# Altium project abdullah-liquidlevelrelay.PrjPcb
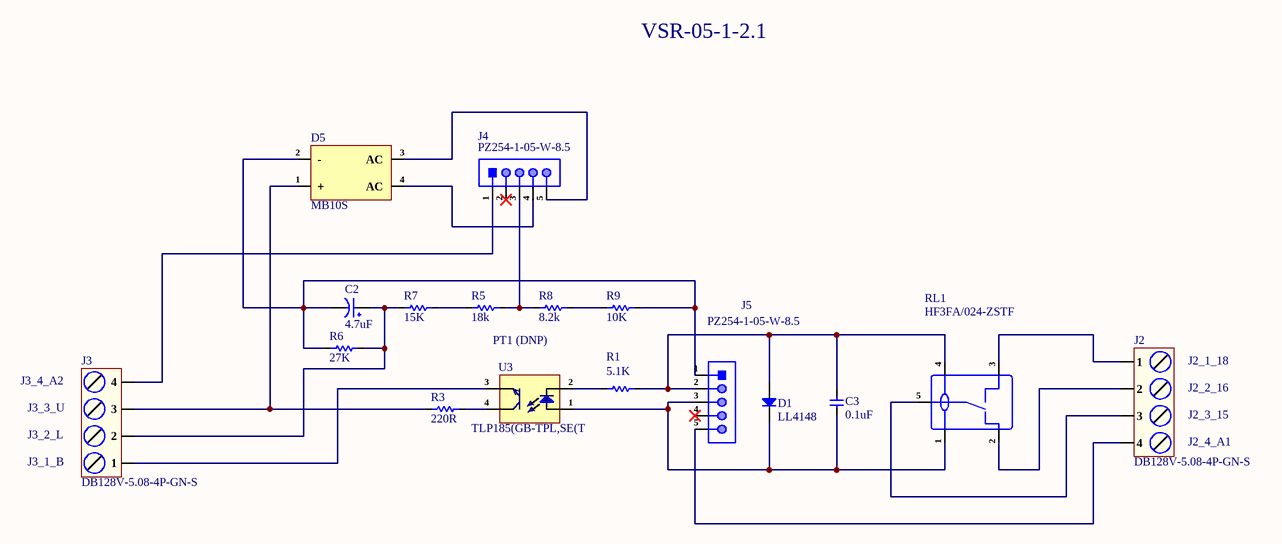
[diagram p0: VSR-05-1-2.1.SchDoc]
2 sheets, 34 parts. Net scope: global (net labels, ports and power ports of the same name join across sheets).
Sheets:
  VSR-05-1-2.1.SchDoc
  VSR-05-2-2.1.SchDoc

## Sheet VSR-05-1-2.1.SchDoc
size A4; SheetNumber: 1; SheetTotal: 1

### Parts
C2  4.7uF  [VT1H4R7M0405]
C3  0.1uF  [Cap-1206]
D1  LL4148  [LL-34]
D5  MB10S  [MBS10S]
J2  DB128V-5.08-4P-GN-S  [DB128V-5.08-4P-GN-S]
J3  DB128V-5.08-4P-GN-S  [DB128V-5.08-4P-GN-S]
J4  PZ254-1-05-W-8.5  [HDR1X5 (R\A)]
J5  PZ254-1-05-W-8.5  [HDR1X5 (R\A)]
R1  5.1K  [RES-0805]
R3  220R  [Res-1206]
R5  18k  [RES-0805]
R6  27K  [RES-0805]
R7  15K  [RES-0805]
R8  8.2k  [RES-0805]
R9  10K  [RES-0805]
RL1  HF3FA/024-ZSTF  [HF3FA/024-ZSTF]
U3  TLP185(GB-TPL,SE(T  [SOP-4_2.54]

### Nets
NetC2_1: C2.1 J3.2 R6.2 R7.1
NetC2_2: C2.2 D5.2(-) J5.1 R6.1 R9.2
NetC3_1: C3.1 D1.2(K) J5.3 RL1.1 U3.1(An)
NetC3_2: C3.2 D1.1(A) J5.2 R1.2 RL1.4
NetD5_1: D5.1(+) J3.3 R3.1
NetD5_3: D5.3(AC) J4.5
NetD5_4: D5.4(AC) J4.4
NetJ2_1: J2.1 RL1.3
NetJ2_2: J2.2 RL1.2
NetJ2_3: J2.3 RL1.5
NetJ2_4: J2.4 J5.5
NetJ3_1: J3.1 U3.3(E)
NetJ3_4: J3.4 J4.1
NetJ4_3: J4.3 R5.2 R8.1
NetR1_1: R1.1 U3.2(Ca)
NetR3_2: R3.2 U3.4(C)
NetR5_1: R5.1 R7.2
NetR8_2: R8.2 R9.1

Not connected (* = marked no-connect by the designer): J4 2*; J5 4*

### Notes on the sheet
- VSR-05-1-2.1
- PT1 (DNP)
- J2_1_18
- J3_4_A2
- J3_3_U
- J3_2_L
- J2_2_16
- J2_3_15
- J3_1_B
- J2_4_A1
- File:
- Title:
- Date:
- Page
- Num:
- Total:
- Drawn By: Huzaifa Ali

### Library data of the parts
C2 = VT1H4R7M0405: 4.7uF 50V 14mA@120Hz ±20% SMD,D4xL5.4mm Aluminum Electrolytic Capacitors - SMD ROHS; Manufacturer: Roqang; Supplier: LCSC; LCSC Part Number: C213488; Manufacturer Part Number: VT1H4R7M0405; RoHS: No; Item Type: Capacitor
C3 = CC1206KKX7R0BB104: CAP CER 0.1UF 100V X7R 1206; Manufacturer: Yageo; Dielectric Material: Ceramic; Tolerance: 10%; Voltage: 63V; Capacitance: 100nF; Item Type: Capacitor; Supplier 1: Avnet; Manufacturer Part Number: CC1206KKX7R0BB104; RoHS: Yes; Category: Ceramic Capacitors; Stock 1: 24000; Pricing 1: 3000=0.01588, 6000=0.01565, 12000=0.01520, 18000=0.01486, 24000=0.01429, 30000=0.01395, 300000=0.01361 (USD); Mount: Surface Mount; Case/Package: 1206; Number of Pins: 2; Case Code (Metric): 3216; Case Code (Imperial): 1206; Min Operating Temperature: -55°C; Max Operating Temperature: 125°C; Dielectric: X7R; Package Quantity: 1; Voltage Rating: 100V; Packaging: Tape and Reel; Voltage Rating (DC): 100V; Termination: SMD/SMT; Resistor Type: Ceramic; Series: CC; Length: 3.2mm; Width: 0.063inch; Height: 1.25mm; Thickness: 0.057inch; Depth: 1.6mm; Radiation Hardening: No; RoHS Compliant: Yes; Reach SVHC Compliant: Yes; Lead Free: Lead Free; ComponentLink1URL: https://datasheet.ciiva.com/7978/1447671-7978227.pdf?src-supplier=Element14; ComponentLink1Description: https://datasheet.ciiva.com/7978/1447671-7978227.pdf?src-supplier=Element14; ComponentLink2URL: https://datasheet.ciiva.com/46391/1919308-46391993.pdf?src-supplier=Element14; ComponentLink2Description: https://datasheet.ciiva.com/46391/1919308-46391993.pdf?src-supplier=Element14; ComponentLink3URL: https://datasheet.ciiva.com/180/mlccorderingcode-180145.pdf?src-supplier=Digi-Key; ComponentLink3Description: https://datasheet.ciiva.com/180/mlccorderingcode-180145.pdf?src-supplier=Digi-Key; ComponentLink4URL: https://datasheet.ciiva.com/180/mlccorderingcode-180144.pdf?src-supplier=Digi-Key; ComponentLink4Description: https://datasheet.ciiva.com/180/mlccorderingcode-180144.pdf?src-supplier=Digi-Key; ComponentLink5URL: https://datasheet.ciiva.com/180/mlccorderingcode-180146.pdf?src-supplier=Digi-Key; ComponentLink5Description: https://datasheet.ciiva.com/180/mlccorderingcode-180146.pdf?src-supplier=Digi-Key; ComponentLink6URL: https://datasheet.ciiva.com/5425/upy-gp-np0-16v-to-50v-8-5425573.pdf?src-supplier=Mouser; ComponentLink6Description: https://datasheet.ciiva.com/5425/upy-gp-np0-16v-to-50v-8-5425573.pdf?src-supplier=Mouser; ComponentLink7URL: https://datasheet.ciiva.com/16981/upy-np0x7r-mv-100-to-630v-9-16981180.pdf?src-supplier=Future+Electronics; ComponentLink7Description: https://datasheet.ciiva.com/16981/upy-np0x7r-mv-100-to-630v-9-16981180.pdf?src-supplier=Future+Electronics; ComponentLink8URL: https://datasheet.ciiva.com/26829/getdatasheetpartid-403790-26829655.pdf?src-supplier=Verical; ComponentLink8Description: https://datasheet.ciiva.com/26829/getdatasheetpartid-403790-26829655.pdf?src-supplier=Verical; Supplier Part Number 1: CC1206KKX7R0BB104; LCSC Part Number: C107181
D1 = LL4148: 75V 1V@10mA 4ns 200mA LL-34 Switching Diode ROHS; Manufacturer: MDD; Manufacturer Part Number: LL4148; Package: LL-34; LCSC Part Number: C435829; Item Type: Diode; ComponentLink1Description: LCSC; ComponentLink1URL: https://www.lcsc.com/product-detail/Switching-Diode_MDD-Microdiode-Electronics-LL4148_C435829.html
D5 = MB10S: 35A 1.1V@400mA 1A 1kV MBS Bridge Rectifiers ROHS; Manufacturer: MDD; Manufacturer Part Number: MB10S; Package: MBS; JLCPCB Part Number: C2488; Item Type: Bridge Rectifier; ComponentLink1Description: LCSC; ComponentLink1URL: https://www.lcsc.com/product-detail/Bridge-Rectifiers_MCC_MB6S-TP_MB6S-TP_C85619.html?gclid=CjwKCAjwjOunBhB4EiwA94JWsPhP5VxdRhkKtNAXxaeRo8Kbw1z5VNRY74bvbkYd4a4LtLXYHGrsEhoCPX4QAvD_BwE
J2 J3 = DB128V-5.08-4P-GN-S: 1x4P 20A -40℃~+105℃ 300V Green 12~30 Straight 5.08mm 2.5 1 4 Plugin,P=5.08mm Screw terminal ROHS; Manufacturer: DORABO; Manufacturer Part Number: DB128V-5.08-4P-GN-S; Package: Plugin,P=5.08mm; LCSC Part Number: C2915641; Item Type: Screw terminal; ComponentLink1Description: LCSC; ComponentLink1URL: https://www.lcsc.com/product-detail/Screw-terminal_DORABO-DB128V-5-08-4P-GN-S_C2915641.html
J4 J5 = PZ254-1-05-W-8.5: 3A Right-Angle Square Pins 2.5mm 260℃@10S 5P 6mm -40℃~+105℃ 2.54mm Plugin Black 1x5P Push-Pull,P=2.54mm Pin Headers ROHS; Manufacturer: HCTL; Manufacturer Part Number: PZ254-1-05-W-8.5; Package: Push-Pull,P=2.54mm; LCSC Part Number: C2894947; Item Type: Pin Headers; ComponentLink1Description: LCSC; ComponentLink1URL: https://www.lcsc.com/product-detail/Pin-Headers_HCTL-PZ254-1-05-W-8-5_C2894947.html
R1 = 0805W8F5101T5E: 125mW Thick Film Resistors 150V ±100ppm/℃ ±1% 5.1kΩ 0805 Chip Resistor - Surface Mount ROHS; Manufacturer: UNI-ROYAL; Manufacturer Part Number: 0805W8F5101T5E; Package: 0805; LCSC Part Number: C27834; Item Type: Resistor; ComponentLink1Description: LCSC; ComponentLink1URL: https://www.lcsc.com/product-detail/Chip-Resistor-Surface-Mount_UNI-ROYAL-Uniroyal-Elec-0805W8F5101T5E_C27834.html
R3 = 1206W4F2200T5E: 250mW Thick Film Resistors 200V ±100ppm/℃ ±1% 220Ω 1206 Chip Resistor - Surface Mount ROHS; Manufacturer: Uniroyal; Supplier: LCSC; LCSC Part Number: C17957; Manufacturer Part Number: 1206W4F2200T5E; RoHS: No; Category: LDO; Item Type: Resistor
R5 = 0805W8F1802T5E: 125mW Thick Film Resistors 150V ±100ppm/℃ ±1% 18kΩ 0805 Chip Resistor - Surface Mount ROHS; Manufacturer: Royal Electronic Factory; Value: 18kR; Supplier: Mouser; Supplier Part Number: 303-0805W8F1802T5E; Manufacturer Part Number: 0805W8F1802T5E; RoHS: No; Stock: 80000; Pricing: 10000=0.002 (USD); LCSC Part Number: C17506; Item Type: Resistor
R6 = 0805W8F2702T5E: 125mW Thick Film Resistors 150V ±100ppm/℃ ±1% 27kΩ 0805 Chip Resistor - Surface Mount ROHS; Manufacturer: Royal Electronic Factory; Value: 27kR; Supplier: Mouser; Supplier Part Number: 303-0805W8F2702T5E; Manufacturer Part Number: 0805W8F2702T5E; RoHS: No; Item Type: Resistor; Stock: 75000; Pricing: 10000=0.002 (USD); LCSC Part Number: C17593
R7 = 0805W8F1502T5E: 125mW Thick Film Resistors 150V ±100ppm/℃ ±1% 15kΩ 0805 Chip Resistor - Surface Mount ROHS; Manufacturer: Uniroyal; Supplier: LCSC; LCSC Part Number: C17475; Manufacturer Part Number: 0805W8F1502T5E; RoHS: Yes; Category: LDO; Item Type: Resistor
R8 = 0805W8F8201T5E: 125mW Thick Film Resistors 150V ±100ppm/℃ ±1% 8.2kΩ 0805 Chip Resistor - Surface Mount ROHS; Manufacturer: Royal Electronic Factory; Value: 8.2kR; Supplier: Mouser; Supplier Part Number: 303-0805W8F8201T5E; Manufacturer Part Number: 0805W8F8201T5E; RoHS: No; Item Type: Resistor; Pricing: 10000=0.002 (USD); LCSC Part Number: C17828
R9 = RC0805FR-7W10KL: RES 10K OHM 1% 1/4W 0805; Manufacturer: Yageo; Item Type: Resistor; Supplier: Avnet; Supplier Part Number: 49AK3472; Manufacturer Part Number: RC0805FR-7W10KL; RoHS: Yes; Category: Chip SMD Resistors; Stock: 5000; Pricing: 1=0.153, 25=0.038, 50=0.03, 100=0.02 (USD); LCSC Part Number: C723404
RL1 = HF3FA/024-ZSTF: 24V SPDT (1 Form C) Plugin,15.2x19mm Power Relays ROHS; Manufacturer: HF(Xiamen Hongfa Electroacoustic); Manufacturer Part Number: HF3FA/024-ZSTF; Package: Plugin,15.2x19mm; LCSC Part Number: C194242; Item Type: Power Relay; ComponentLink1Description: LCSC; ComponentLink1URL: https://www.lcsc.com/product-detail/Power-Relays_HF-Xiamen-Hongfa-Electroacoustic-HF3FA-024-ZSTF_C194242.html
U3 = TLP185(GB-TPL,SE(T: 80V 3.75kV 50mA 300mV@2.4mA,8mA 1 5V 1.25V DC SOP-4-2.54mm Transistor Output Optocoupler ROHS; Manufacturer: TOSHIBA; Manufacturer Part Number: TLP185(GB-TPL,SE(T; Package: SOP-4-2.54mm; LCSC Part Number: C7240; Item Type: Optocoupler; ComponentLink1Description: LCSC; ComponentLink1URL: https://www.lcsc.com/product-detail/Transistor-Output-Optocoupler_TOSHIBA-TLP185-GB-TPL-SE-T_C7240.html

## Sheet VSR-05-2-2.1.SchDoc
size A4; SheetNumber: 2; SheetTotal: 2
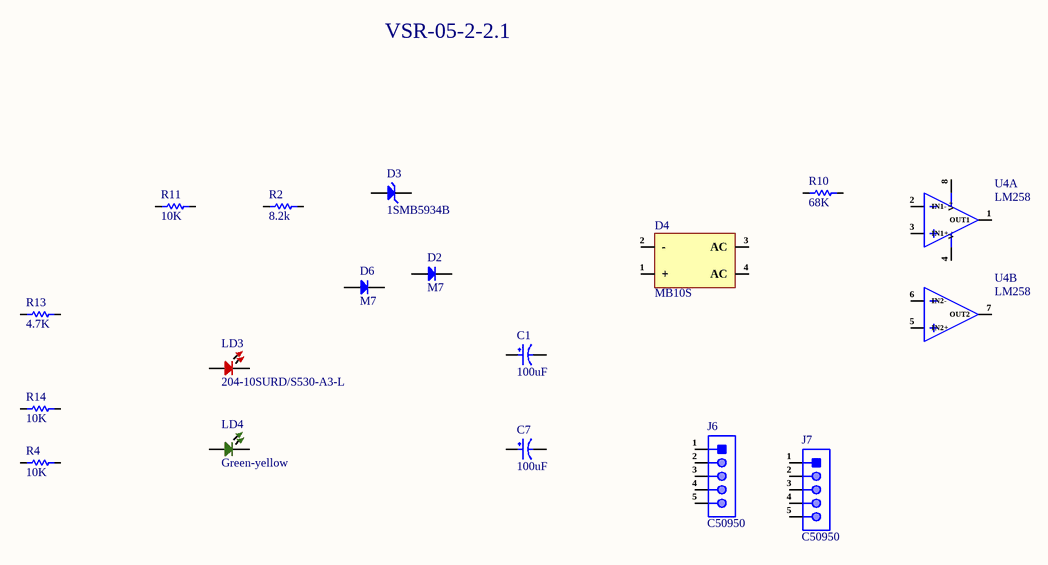
[diagram p1: VSR-05-2-2.1.SchDoc]

### Parts
C1  100uF  [RVT1H101M0607]
C7  100uF  [RVT1H101M0607]
D2  M7  [SMA(DO-214AC)]
D3  1SMB5934B  [SMB_]
D4  MB10S  [MBS10S]
D6  M7  [SMA(DO-214AC)]
J6  C50950  [HDR 1x5 Female]
J7  C50950  [HDR 1x5 Female]
LD3  204-10SURD/S530-A3-L
LD4  Green-yellow  [TH LED Green 3MM]
R2  8.2k  [RES-0805]
R4  10K  [RES-0805]
R10  68K  [RES-0805]
R11  10K  [RES-0805]
R13  4.7K  [RES-0805]
R14  10K  [RES-0805]
U4  LM258  [SOP-8]  (parts A,B of 2)

### Nets

Not connected (* = marked no-connect by the designer): C1 1 2; C7 1 2; D2 1(K) 2(A); D3 1(A) 2(K); D4 1(+) 2(-) 3(AC) 4(AC); D6 1(K) 2(A); J6 1 2 3 4 5; J7 1 2 3 4 5; LD3 1 2; LD4 1 2; R2 1 2; R4 1 2; R10 1 2; R11 1 2; R13 1 2; R14 1 2; U4 1(OUT1) 2(IN1-) 3(IN1+) 4(V-) 5(IN2+) 6(IN2-) 7(OUT2) 8(V+)

### Notes on the sheet
- VSR-05-2-2.1

### Library data of the parts
C1 C7 = RVT1H101M0607: 100uF 50V ±20% SMD,D6.3xL7.7mm Aluminum Electrolytic Capacitors - SMD ROHS; Manufacturer: ROQANG; Manufacturer Part Number: RVT1H101M0607; Package: SMD,D6.3xL7.7mm; LCSC Part Number: C3151829; Item Type: Capacitor; ComponentLink1Description: LCSC; ComponentLink1URL: https://www.lcsc.com/product-detail/Aluminum-Electrolytic-Capacitors-SMD_ROQANG-RVT1H101M0607_C3151829.html
D2 D6 = M7: 1A 1.1V@1A 1kV DO-214AC Diodes - General Purpose ROHS; Manufacturer: MSKSEMI; Item Type: Diode; Manufacturer Part Number: M7; Package: DO-214AC; LCSC Part Number: C2902910; ComponentLink1Description: LCSC; ComponentLink1URL: https://www.lcsc.com/product-detail/Diodes-General-Purpose_MSKSEMI-M7_C2902910.html
D3 = 1SMB5934B: 3W 24V SMB Zener Diodes ROHS; Manufacturer: YFW; Item Type: Diode; Manufacturer Part Number: 1SMB5934B; Package: SMB; LCSC Part Number: C2988044; ComponentLink1Description: LCSC; ComponentLink1URL: https://www.lcsc.com/product-detail/Zener-Diodes_YFW-1SMB5934B_C2988044.html
D4 = MB10S: as D5 on sheet VSR-05-1-2.1; Manufacturer Part Number: MB10S; Package: MBS; JLCPCB Part Number: C2488; Item Type: Bridge Rectifier; ComponentLink1Description: LCSC; ComponentLink1URL: https://www.lcsc.com/product-detail/Bridge-Rectifiers_MCC_MB6S-TP_MB6S-TP_C85619.html?gclid=CjwKCAjwjOunBhB4EiwA94JWsPhP5VxdRhkKtNAXxaeRo8Kbw1z5VNRY74bvbkYd4a4LtLXYHGrsEhoCPX4QAvD_BwE
J6 J7 = C50950: 2.54mm Plugin Straight 1x5P 5 Plugin,P=2.54mm Female Headers ROHS; Manufacturer: BOOMELE; Manufacturer Part Number: C50950; Package: Plugin,P=2.54mm; LCSC Part Number: C50950; Item Type: Female Header; ComponentLink1Description: LCSC; ComponentLink1URL: https://www.lcsc.com/product-detail/Female-Headers_BOOMELE-Boom-Precision-Elec-C50950_C50950.html
LD3 = 204-10SURD/S530-A3-L: 20mA 624nm -40℃~+85℃ Red 40° 3mm圆形灯头 60mW Plugin,D=3mm Light Emitting Diodes (LED) ROHS; Manufacturer: Everlight Elec; Manufacturer Part Number: 204-10SURD/S530-A3-L; Package: Plugin,D=3mm; LCSC Part Number: C99771; Item Type: LED; ComponentLink1Description: LCSC; ComponentLink1URL: https://www.lcsc.com/product-detail/Light-Emitting-Diodes-LED_Everlight-Elec-204-10SURD-S530-A3-L_C99771.html
LD4 = 204-10SYGD/S530-E3: LED Single Standard Yellow Green 573nm 25mA 2-Pin T-1 Bag; Manufacturer: Everlight; Viewing Angle: 45°; Luminous Intensity: 100mcd; Forward Voltage: 2.4V; Lens Style: Diffused,Colored; Power Dissipation: 60W; Number of Elements: 1; Reverse Voltage: 5V; Supplier: Digikey; Supplier Part Number: 1080-204-10SYGD/S530-E3TR-ND; Manufacturer Part Number: 204-10SYGD/S530-E3; RoHS: Yes; Pricing: 3000=0.10482, 5000=0.09847, 10000=0.09212, 25000=0.08449, 50000=0.08132, 100000=0.07941 (USD); Mounting Technology: Through Hole; Case/Package: T; Pins: 2; Min Operating Temperature: -40°C; Max Operating Temperature: 85°C; Forward Current: 25mA; Packaging: Tape and Reel; Dominant Wavelength: 573nm; Wavelength: 573nm; Length: 4mm; Depth: 4mm; Radiation Hardening: No; RoHS Compliant: Yes; ComponentLink1URL: https://datasheet.ciiva.com/26901/getdatasheetpartid-707371-26901329.pdf?src-supplier=Verical; ComponentLink1Description: https://datasheet.ciiva.com/26901/getdatasheetpartid-707371-26901329.pdf?src-supplier=Verical; LCSC Part Number: C85161; Item Type: LED
R2 = 0805W8F8201T5E: as R8 on sheet VSR-05-1-2.1; Supplier: Mouser; Supplier Part Number: 303-0805W8F8201T5E; Manufacturer Part Number: 0805W8F8201T5E; RoHS: No; Item Type: Resistor; Pricing: 10000=0.002 (USD); LCSC Part Number: C17828
R4 R11 R14 = RC0805FR-7W10KL: as R9 on sheet VSR-05-1-2.1; Supplier: Avnet; Supplier Part Number: 49AK3472; Manufacturer Part Number: RC0805FR-7W10KL; RoHS: Yes; Category: Chip SMD Resistors; Stock: 5000; Pricing: 1=0.153, 25=0.038, 50=0.03, 100=0.02 (USD); LCSC Part Number: C723404
R10 = 0805W8F6802T5E: 125mW Thick Film Resistors 150V ±100ppm/℃ ±1% 68kΩ 0805 Chip Resistor - Surface Mount ROHS; Manufacturer: Royal Electronic Factory; Value: 68kR; Supplier: Mouser; Supplier Part Number: 303-0805W8F6802T5E; Manufacturer Part Number: 0805W8F6802T5E; RoHS: Yes; Item Type: Resistor; Stock: 85000; Pricing: 10000=0.002 (USD); RoHS Compliant: Yes; LCSC Part Number: C17801
R13 = CRCW08054K70FKEAHP: RES SMD 4.7K OHM 1% 1/2W 0805; Manufacturer: Vishay; Power Rating: 330mW; Voltage Rating: 150V; Resistance: 4.7kR; Temperature Coefficient: 100ppm/°C; Max Power Dissipation: 500mW; Item Type: Resistor; Supplier 1: RSComponents; Manufacturer Part Number: CRCW08054K70FKEAHP; RoHS: Yes; Category: Chip SMD Resistors; Stock 1: 5000; Pricing 1: 25=0.16800, 100=0.15700, 250=0.14600, 500=0.13600, 1000=0.12500 (GBP); Mount: Surface Mount; Case/Package: 0805; Weight: 0.000194oz; Case Code (Imperial): 0805; Case Code (Metric): 2012; Contact Plating: Tin; Min Operating Temperature: -55°C; Max Operating Temperature: 155°C; Tolerance: 1%; Packaging: Tape and Reel; Package Quantity: 5000; Resistor Type: Thick Film; Termination: SMD/SMT; Voltage Rating (DC): 150V; Features: Automotive AEC-Q200; Series: CRCW-HP; Number of Terminations: 2; Resistance Tolerance: 1%; Construction: Rectangular; Technology: THICK FILM; Length: 2mm; Width: 1.2mm; Height: 0.5mm; Depth: 1.25mm; Ratings: AEC-Q200; Radiation Hardening: No; Military Standard: Not; Lead Free: Lead Free; RoHS Compliant: Yes; ComponentLink1URL: https://datasheet.ciiva.com/8079/424479-8079653.pdf?src-supplier=Element14; ComponentLink1Description: https://datasheet.ciiva.com/8079/424479-8079653.pdf?src-supplier=Element14; ComponentLink2URL: https://datasheet.ciiva.com/9072/crcwhpe3-9072073.pdf?src-supplier=Avnet; ComponentLink2Description: https://datasheet.ciiva.com/9072/crcwhpe3-9072073.pdf?src-supplier=Avnet; LCSC Part Number: C313926; Supplier Part Number 1: 8123574
U4 = LM258: Dual 250nA 5mV SOP-8 Operational Amplifier ROHS; Manufacturer: HXY MOSFET; Item Type: Opam; Manufacturer Part Number: LM258; Package: SOP-8; LCSC Part Number: C6851436; ComponentLink1Description: LCSC; ComponentLink1URL: https://www.lcsc.com/product-detail/Operational-Amplifier_HXY-MOSFET-LM258_C6851436.html